# Altium schematic sheet Battery_Management_Section.SchDoc
size A4; DocumentNumber: 4; SheetNumber: 4
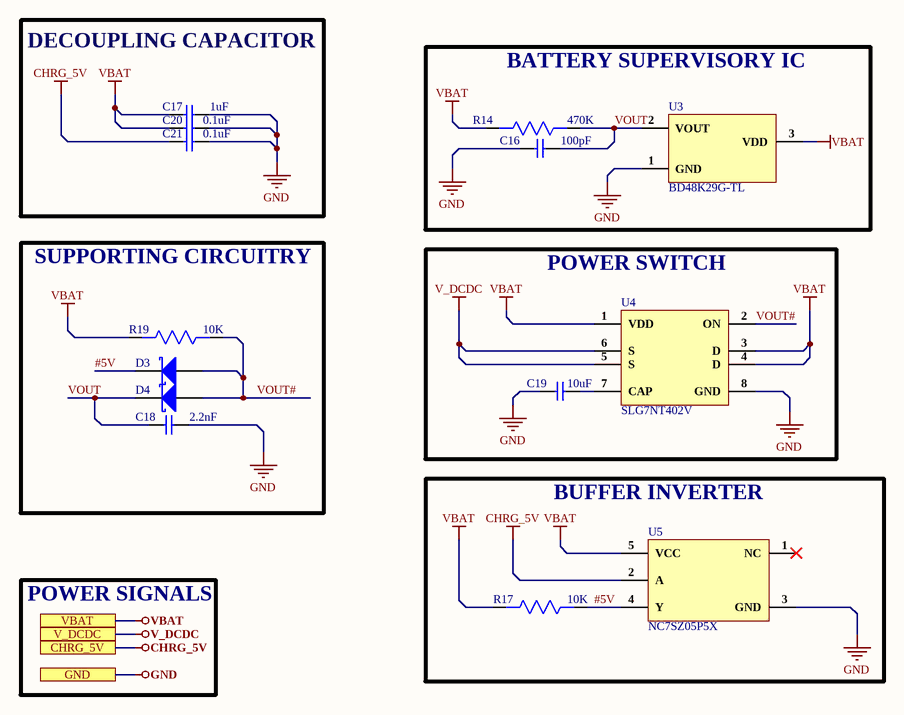
[diagram p0: Battery_Management_Section.SchDoc]

## Parts
C16  100pF  [Cap0603]
C17  1uF  [Cap0603]
C18  2.2nF  [Cap 0402]
C19  10uF  [Cap0603]
C20  0.1uF  [Cap0603]
C21  0.1uF  [Cap0603]
D3  SDM2U20SD3-7  [SDM2U20SD3-7]  (value not drawn)
D4  SDM2U20SD3-7  [SDM2U20SD3-7]  (value not drawn)
R14  470K  [Res0603]
R17  10K  [Res0603]
R19  10K  [Res0603]
U3  BD48K29G-TL  [3-SSOP]
U4  SLG7NT402V  [SLG7NT402V]
U5  NC7SZ05P5X  [NC7SZ05P5X]

## Blocks framed on the sheet
DECOUPLING CAPACITOR: C17 C20 C21
BATTERY SUPERVISORY IC: C16 R14 U3
SUPPORTING CIRCUITRY: C18 D3 D4 R19
POWER SWITCH: C19 U4
BUFFER INVERTER: R17 U5

## Ports
CHRG_5V, GND, V_DCDC, VBAT

## Nets
CHRG_5V: C21.1 U5.2(A) ; port CHRG_5V
GND: C16.2 C17.1 C18.2 C19.1 C20.2 C21.2 U3.1(GND) U4.8(GND) U5.3(GND) ; port GND
V_DCDC: U4.5(S) U4.6(S) ; port V_DCDC
VBAT: C17.2 C20.1 R14.1 R17.2 R19.2 U3.3(VDD) U4.1(VDD) U4.3(D) U4.4(D) U5.5(VCC) ; port VBAT
#5V: D3.2(K) R17.1 U5.4(Y)
VOUT: C16.1 C18.1 D4.2(K) R14.2 U3.2(VOUT)
VOUT#: D3.1(A) D4.1(A) R19.1 U4.2(ON)
NetC19_2: C19.2 U4.7(CAP)

Not connected (* = marked no-connect by the designer): U5 1(NC)*

## Notes on the sheet
- POWER SIGNALS

## Library data of the parts
C16 = CC0603JRNPO8BN101: CAP CER 100PF 25V C0G/NPO 0603; Manufacturer: Yageo; Tolerance: 5%; Dielectric: C0G; ComponentLink1URL: http://www.yageo.com/documents/recent/UPY-GPHC_Y5V_6.3V-to-50V_8.pdf?src-supplier=Digi-Key; ComponentLink1Description: http://www.yageo.com/documents/recent/UPY-GPHC_Y5V_6.3V-to-50V_8.pdf?src-supplier=Digi-Key; ComponentLink2URL: http://www.yageo.com/documents/recent/UPY-GPHC_Y5V_6.3V-to-50V_5.pdf?src-supplier=Avnet+Europe; ComponentLink2Description: http://www.yageo.com/documents/recent/UPY-GPHC_Y5V_6.3V-to-50V_5.pdf?src-supplier=Avnet+Europe; ComponentLink3URL: https://www.verical.com/server-webapp/html/getDatasheet?partID=403611&src-supplier=Verical; ComponentLink3Description: https://www.verical.com/server-webapp/html/getDatasheet?partID=403611&src-supplier=Verical; ComponentLink4URL: http://www.mouser.com/ds/2/447/Yageo_UPY-GP_NP0_16V-to-50V_9-358835.pdf?src-supplier=Mouser; ComponentLink4Description: http://www.mouser.com/ds/2/447/Yageo_UPY-GP_NP0_16V-to-50V_9-358835.pdf?src-supplier=Mouser; ComponentLink5URL: http://www.farnell.com/datasheets/1132289.pdf?src-supplier=Element14; ComponentLink5Description: http://www.farnell.com/datasheets/1132289.pdf?src-supplier=Element14; Supplier 1: Digi-Key; Manufacturer Part Number: CC0603JRNPO8BN101; Stock 1: 19776; Pricing 1: 1=0.1, 10=0.058, 50=0.0318, 100=0.026, 500=0.0186, 1000=0.0146 (USD); Mount: Surface Mount; Case/Package: 0603; Min Operating Temperature: -55°C; Max Operating Temperature: 125°C; Capacitance: 100pF; Voltage Rating (DC): 25V; Packaging: Tape and Reel; Voltage Rating: 25V; Resistor Type: Ceramic; Series: CC; Construction: Flat; Length: 0.063inch; Width: 0.031inch; Height: 0.8mm; Thickness: 0.035inch; Depth: 0.8mm; Radiation Hardening: No; RoHS Compliant: Yes; ComponentLink6URL: http://www.yageo.com/documents/recent/UPY-GP_NP0_16V-to-50V_8.pdf?src-supplier=Avnet; ComponentLink6Description: http://www.yageo.com/documents/recent/UPY-GP_NP0_16V-to-50V_8.pdf?src-supplier=Avnet; ComponentLink7URL: http://www.yageo.com/documents/recent/UPY-GP_NP0_16V-to-50V_8.pdf?src-supplier=Avnet+Europe; ComponentLink7Description: http://www.yageo.com/documents/recent/UPY-GP_NP0_16V-to-50V_8.pdf?src-supplier=Avnet+Europe; Supplier Part Number 1: 311-3949-1-ND
C17 = CC0603ZRY5V8BB105: CAP CER 1UF 25V Y5V 0603; Manufacturer: Yageo; Tolerance: 80%; ComponentLink1URL: http://www.yageo.com/documents/recent/UPY-GPHC_Y5V_6.3V-to-50V_8.pdf?src-supplier=Digi-Key; ComponentLink1Description: http://www.yageo.com/documents/recent/UPY-GPHC_Y5V_6.3V-to-50V_8.pdf?src-supplier=Digi-Key; ComponentLink2URL: http://www.yageo.com/documents/recent/UPY-GPHC_Y5V_6.3V-to-50V_5.pdf?src-supplier=Avnet+Europe; ComponentLink2Description: http://www.yageo.com/documents/recent/UPY-GPHC_Y5V_6.3V-to-50V_5.pdf?src-supplier=Avnet+Europe; ComponentLink3URL: https://www.verical.com/server-webapp/html/getDatasheet?partID=403611&src-supplier=Verical; ComponentLink3Description: https://www.verical.com/server-webapp/html/getDatasheet?partID=403611&src-supplier=Verical; ComponentLink4URL: http://www.mouser.com/ds/2/447/Yageo_UPY-GP_NP0_16V-to-50V_9-358835.pdf?src-supplier=Mouser; ComponentLink4Description: http://www.mouser.com/ds/2/447/Yageo_UPY-GP_NP0_16V-to-50V_9-358835.pdf?src-supplier=Mouser; ComponentLink5URL: http://www.farnell.com/datasheets/1132289.pdf?src-supplier=Element14; ComponentLink5Description: http://www.farnell.com/datasheets/1132289.pdf?src-supplier=Element14; Supplier 1: Digi-Key; Manufacturer Part Number: CC0603ZRY5V8BB105; Stock 1: 82432; Pricing 1: 1=0.13, 10=0.096, 50=0.0544, 100=0.045, 500=0.0316, 1000=0.0261 (USD); Mount: Surface Mount; Case/Package: 0603; Case Code (Imperial): 0603; Case Code (Metric): 1608; Min Operating Temperature: -30°C; Max Operating Temperature: 85°C; Voltage Rating (DC): 25V; Packaging: Tape and Reel; Capacitance: 1uF; Voltage Rating: 25V; Dielectric: Y5V; Termination: SMD/SMT; Resistor Type: Ceramic; Series: CC; Length: 0.063inch; Width: 0.031inch; Height: 0.8mm; Thickness: 0.035inch; Lead Free: Lead Free; Halogen Free: Halogen Free; RoHS Compliant: Yes; Supplier Part Number 1: 311-1829-1-ND
C18 = C0402C222J3GEC7867: CAP CER 0402 2.2NF 25V C0G 5%; Manufacturer: KEMET; ComponentLink1URL: http://www.yageo.com/documents/recent/UPY-GPHC_Y5V_6.3V-to-50V_8.pdf?src-supplier=Digi-Key; ComponentLink1Description: http://www.yageo.com/documents/recent/UPY-GPHC_Y5V_6.3V-to-50V_8.pdf?src-supplier=Digi-Key; ComponentLink2URL: http://www.yageo.com/documents/recent/UPY-GPHC_Y5V_6.3V-to-50V_5.pdf?src-supplier=Avnet+Europe; ComponentLink2Description: http://www.yageo.com/documents/recent/UPY-GPHC_Y5V_6.3V-to-50V_5.pdf?src-supplier=Avnet+Europe; ComponentLink3URL: https://www.verical.com/server-webapp/html/getDatasheet?partID=403611&src-supplier=Verical; ComponentLink3Description: https://www.verical.com/server-webapp/html/getDatasheet?partID=403611&src-supplier=Verical; ComponentLink4URL: http://www.mouser.com/ds/2/447/Yageo_UPY-GP_NP0_16V-to-50V_9-358835.pdf?src-supplier=Mouser; ComponentLink4Description: http://www.mouser.com/ds/2/447/Yageo_UPY-GP_NP0_16V-to-50V_9-358835.pdf?src-supplier=Mouser; ComponentLink5URL: http://www.farnell.com/datasheets/1132289.pdf?src-supplier=Element14; ComponentLink5Description: http://www.farnell.com/datasheets/1132289.pdf?src-supplier=Element14; ComponentLink6URL: http://www.yageo.com/documents/recent/UPY-GP_NP0_16V-to-50V_8.pdf?src-supplier=Avnet; ComponentLink6Description: http://www.yageo.com/documents/recent/UPY-GP_NP0_16V-to-50V_8.pdf?src-supplier=Avnet; ComponentLink7URL: http://www.yageo.com/documents/recent/UPY-GP_NP0_16V-to-50V_8.pdf?src-supplier=Avnet+Europe; ComponentLink7Description: http://www.yageo.com/documents/recent/UPY-GP_NP0_16V-to-50V_8.pdf?src-supplier=Avnet+Europe; Supplier 1: Digi-Key; Manufacturer Part Number: C0402C222J3GEC7867; Stock 1: 5024; Pricing 1: 1=0.17, 10=0.123, 50=0.07, 100=0.058, 500=0.0407, 1000=0.0337, 2500=0.0314, 5000=0.0287 (USD); ComponentLink8URL: https://api.kemet.com/component-edge/download/datasheet/C0402C222J3GEC7867.pdf?src-supplier=Digi-Key; ComponentLink8Description: https://api.kemet.com/component-edge/download/datasheet/C0402C222J3GEC7867.pdf?src-supplier=Digi-Key; Supplier Part Number 1: 399-C0402C222J3GEC7867CT-ND
C19 = CC0603MRX5R8BB106: CAP CER 10UF 25V X5R 0603; Manufacturer: Yageo; Tolerance: 20%; ComponentLink1URL: http://www.yageo.com/documents/recent/UPY-GPHC_Y5V_6.3V-to-50V_8.pdf?src-supplier=Digi-Key; ComponentLink1Description: http://www.yageo.com/documents/recent/UPY-GPHC_Y5V_6.3V-to-50V_8.pdf?src-supplier=Digi-Key; ComponentLink2URL: http://www.yageo.com/documents/recent/UPY-GPHC_Y5V_6.3V-to-50V_5.pdf?src-supplier=Avnet+Europe; ComponentLink2Description: http://www.yageo.com/documents/recent/UPY-GPHC_Y5V_6.3V-to-50V_5.pdf?src-supplier=Avnet+Europe; ComponentLink3URL: https://www.verical.com/server-webapp/html/getDatasheet?partID=403611&src-supplier=Verical; ComponentLink3Description: https://www.verical.com/server-webapp/html/getDatasheet?partID=403611&src-supplier=Verical; ComponentLink4URL: http://www.mouser.com/ds/2/447/Yageo_UPY-GP_NP0_16V-to-50V_9-358835.pdf?src-supplier=Mouser; ComponentLink4Description: http://www.mouser.com/ds/2/447/Yageo_UPY-GP_NP0_16V-to-50V_9-358835.pdf?src-supplier=Mouser; ComponentLink5URL: http://www.farnell.com/datasheets/1132289.pdf?src-supplier=Element14; ComponentLink5Description: http://www.farnell.com/datasheets/1132289.pdf?src-supplier=Element14; Supplier 1: Digi-Key; Manufacturer Part Number: CC0603MRX5R8BB106; Stock 1: 0; Pricing 1: 1=0.77, 10=0.568, 50=0.4542, 100=0.3893, 500=0.3082, 1000=0.2595 (USD); Mount: Surface Mount; Case/Package: 0603; Case Code (Imperial): 0603; Case Code (Metric): 1608; Min Operating Temperature: -55°C; Max Operating Temperature: 85°C; Packaging: Cut Tape; Capacitance: 10uF; Voltage Rating: 25V; RoHS Compliant: Yes; ComponentLink6URL: https://www.yageo.com/upload/media/product/productsearch/datasheet/mlcc/UPY-GPHC_X5R_4V-to-50V_26.pdf?src-supplier=Digi-Key; ComponentLink6Description: https://www.yageo.com/upload/media/product/productsearch/datasheet/mlcc/UPY-GPHC_X5R_4V-to-50V_26.pdf?src-supplier=Digi-Key; Supplier Part Number 1: 311-3494-6-ND
C20 C21 = CC0603ZRY5V9BB104: CAP CER 0.1UF 50V Y5V 0603; Manufacturer: Yageo; Capacitance: 100nF; Tolerance: 80%; Supplier 1: Digi-Key; Manufacturer Part Number: CC0603ZRY5V9BB104; Stock 1: 15000880; Pricing 1: 1=0.1, 10=0.075, 100=0.0334, 500=0.02386, 1000=0.01874 (USD); Mount: Surface Mount; Case/Package: 0603; Number of Pins: 2; Case Code (Metric): 1608; Case Code (Imperial): 0603; Min Operating Temperature: -30°C; Max Operating Temperature: 85°C; Dielectric: Y5V; Voltage Rating: 50V; Package Quantity: 1; Packaging: Tape and Reel; Voltage Rating (DC): 50V; Termination: SMD/SMT; Composition: Ceramic; Voltage: 50V; Length: 1.6mm; Height: 0.8mm; Width: 0.031inch; Thickness: 0.035inch; Depth: 0.8mm; Radiation Hardening: No; REACH SVHC: No SVHC; Lead Free: Lead Free; Halogen Free: Halogen Free; ComponentLink1URL: http://www.yageo.com/documents/recent/UPY-GPHC_Y5V_6.3V-to-50V_8.pdf?src-supplier=Digi-Key; ComponentLink1Description: http://www.yageo.com/documents/recent/UPY-GPHC_Y5V_6.3V-to-50V_8.pdf?src-supplier=Digi-Key; ComponentLink2URL: http://www.yageo.com/documents/recent/UPY-GPHC_Y5V_6.3V-to-50V_5.pdf?src-supplier=Avnet+Europe; ComponentLink2Description: http://www.yageo.com/documents/recent/UPY-GPHC_Y5V_6.3V-to-50V_5.pdf?src-supplier=Avnet+Europe; ComponentLink3URL: https://www.verical.com/server-webapp/html/getDatasheet?partID=403611&src-supplier=Verical; ComponentLink3Description: https://www.verical.com/server-webapp/html/getDatasheet?partID=403611&src-supplier=Verical; ComponentLink4URL: http://www.mouser.com/ds/2/447/Yageo_UPY-GP_NP0_16V-to-50V_9-358835.pdf?src-supplier=Mouser; ComponentLink4Description: http://www.mouser.com/ds/2/447/Yageo_UPY-GP_NP0_16V-to-50V_9-358835.pdf?src-supplier=Mouser; ComponentLink5URL: http://www.farnell.com/datasheets/1132289.pdf?src-supplier=Element14; ComponentLink5Description: http://www.farnell.com/datasheets/1132289.pdf?src-supplier=Element14; Supplier Part Number 1: 311-1343-1-ND
D3 D4 = SDM2U20SD3-7: DIODE SCHOTTKY 20V 2A SOD323; Manufacturer: Diodes; Supplier 1: Digi-Key; Manufacturer Part Number: SDM2U20SD3-7; RoHS: Yes; Category: Rectifier Diodes; Stock 1: 6; Pricing 1: 1=0.47000, 10=0.35200, 100=0.19930, 500=0.13200, 1000=0.10120 (USD); Mount: Surface Mount; Packaging: Cut Tape; Average Rectified Current: 2A; Max Reverse Voltage (DC): 20V; RoHS Compliant: Yes; ComponentLink1URL: http://www.mouser.com/ds/2/115/SDM2U20SD3-537776.pdf?src-supplier=Mouser; ComponentLink1Description: http://www.mouser.com/ds/2/115/SDM2U20SD3-537776.pdf?src-supplier=Mouser; ComponentLink2URL: https://www.diodes.com/assets/Datasheets/SDM2U20SD3.pdf?src-supplier=Digi-Key; ComponentLink2Description: https://www.diodes.com/assets/Datasheets/SDM2U20SD3.pdf?src-supplier=Digi-Key; ComponentLink3URL: http://diodes.com/datasheets/SDM2U20SD3.pdf?src-supplier=Avnet; ComponentLink3Description: http://diodes.com/datasheets/SDM2U20SD3.pdf?src-supplier=Avnet; Supplier Part Number 1: SDM2U20SD3-7DICT-ND
R14 = RC0603JR-07470KL: RES 470K OHM 5% 1/10W 0603; Manufacturer: Yageo; Resistance: 470kR; Temperature Coefficient: 100ppm/°C; Voltage Rating (DC): 50V; Power Rating: 100mW; Voltage Rating: 75V; ComponentLink1URL: https://datasheet.ciiva.com/2452/pyu-r-int-thick-7-2452918.pdf?src-supplier=Digi-Key; ComponentLink1Description: https://datasheet.ciiva.com/2452/pyu-r-int-thick-7-2452918.pdf?src-supplier=Digi-Key; ComponentLink2URL: https://datasheet.ciiva.com/2452/pyu-r-int-thick-7-2452919.pdf?src-supplier=Digi-Key; ComponentLink2Description: https://datasheet.ciiva.com/2452/pyu-r-int-thick-7-2452919.pdf?src-supplier=Digi-Key; ComponentLink3URL: https://datasheet.ciiva.com/7746/443971-7746489.pdf?src-supplier=Element14; ComponentLink3Description: https://datasheet.ciiva.com/7746/443971-7746489.pdf?src-supplier=Element14; ComponentLink4URL: https://datasheet.ciiva.com/7746/443971-7746490.pdf?src-supplier=Element14; ComponentLink4Description: https://datasheet.ciiva.com/7746/443971-7746490.pdf?src-supplier=Element14; ComponentLink5URL: https://datasheet.ciiva.com/46395/443971-46395146.pdf?src-supplier=Element14; ComponentLink5Description: https://datasheet.ciiva.com/46395/443971-46395146.pdf?src-supplier=Element14; ComponentLink6URL: https://datasheet.ciiva.com/15189/getdatasheetpartid-343810-15189869.pdf?src-supplier=Verical; ComponentLink6Description: https://datasheet.ciiva.com/15189/getdatasheetpartid-343810-15189869.pdf?src-supplier=Verical; Supplier 1: Digi-Key; Manufacturer Part Number: RC0603JR-07470KL; Stock 1: 1213798; Pricing 1: 1=0.1, 10=0.02, 100=0.008, 1000=0.0036, 2500=0.0031 (USD); Case/Package: 0603; Number of Pins: 2; Case Code (Metric): 1608; Case Code (Imperial): 0603; Weight: 7.1E-05oz; Size Code: 0603; Min Operating Temperature: -55°C; Max Operating Temperature: 155°C; Tolerance: 5%; Resistor Type: Thick Film; Packaging: Tape and Reel; Package Quantity: 1; Number of Terminations: 2; Termination: SMD/SMT; Max Power Dissipation: 100mW; Features: Moisture Resistant; Series: RC; Resistance Tolerance: 5%; Construction: Rectangular; Length: 1.6mm; Width: 0.8mm; Height: 0.022inch; Depth: 0.8mm; REACH SVHC: No SVHC; Lead Free: Lead Free; Military Standard: Not; RoHS Compliant: Yes; ComponentLink7URL: http://www.yageo.com/documents/recent/PYu-RC_Group_51_RoHS_L_10.pdf?src-supplier=Digi-Key; ComponentLink7Description: http://www.yageo.com/documents/recent/PYu-RC_Group_51_RoHS_L_10.pdf?src-supplier=Digi-Key; ComponentLink8URL: http://www.yageo.com/documents/recent/PYu-RC_Group_51_RoHS_L_9.pdf?src-supplier=Digi-Key; ComponentLink8Description: http://www.yageo.com/documents/recent/PYu-RC_Group_51_RoHS_L_9.pdf?src-supplier=Digi-Key; ComponentLink9URL: http://www.farnell.com/datasheets/1868787.pdf?src-supplier=Element14; ComponentLink9Description: http://www.farnell.com/datasheets/1868787.pdf?src-supplier=Element14; Supplier Part Number 1: 311-470KGRCT-ND
R17 R19 = AC0603JR-0710KL: RES SMD 10K OHM 5% 1/10W 0603; Manufacturer: Yageo; Voltage Rating: 50V; Resistance: 10kR; Power Rating: 100mW; Temperature Coefficient: 100ppm/°C; Supplier 1: Future Electronics; Manufacturer Part Number: AC0603JR-0710KL; RoHS: Yes; Category: Chip SMD Resistors; Stock 1: 1533000; Pricing 1: 5000=0.00540 (USD); Case/Package: 0603; Case Code (Imperial): 0603; Case Code (Metric): 1608; Size Code: 0603; Min Operating Temperature: -55°C; Max Operating Temperature: 155°C; Packaging: Tape and Reel; Tolerance: 5%; Package Quantity: 1; Resistor Type: Thick Film; Termination: SMD/SMT; Number of Terminations: 2; Max Power Dissipation: 100mW; Features: Moisture Resistant,Automotive AEC-Q200,Anti-Sulfur; Series: AC; Construction: Rectangular; Length: 0.063inch; Width: 0.031inch; Height: 0.022inch; Depth: 0.8mm; Military Standard: Not; Lead Free: Lead Free; RoHS Compliant: Yes; ComponentLink1URL: https://datasheet.ciiva.com/5562/pyu-ac-51-rohs-l-2-5562553.pdf?src-supplier=Mouser; ComponentLink1Description: https://datasheet.ciiva.com/5562/pyu-ac-51-rohs-l-2-5562553.pdf?src-supplier=Mouser; Supplier Part Number 1: 1029044
U3 = BD48K29G-TL: IC DETECTOR VOLT 2.9V OD SSOP3; Manufacturer: Rohm; Max Supply Voltage: 6V; Min Supply Voltage: 2.3V; Number of Voltages Monitored: 1; Reset: Active Low; Accuracy: 1%; Operating Supply Current: 900nA; Max Reset Threshold Voltage: 2.929V; Min Reset Threshold Voltage: 2.871V; Supplier 1: Mouser; Manufacturer Part Number: BD48K29G-TL; RoHS: Yes; Category: Voltage Supervisors; Stock 1: 2854; Pricing 1: 1=0.48000, 10=0.39100, 50=0.39100, 100=0.24100, 500=0.20000, 1000=0.15000, 3000=0.13600, 10000=0.13600 (USD); Mount: Surface Mount; Case/Package: SSOP; Number of Pins: 3; Min Operating Temperature: -40°C; Max Operating Temperature: 105°C; Packaging: Tape and Reel; Package Quantity: 1; Threshold Voltage: 2.9V; Number of Monitored Inputs: 1; Type: Simple Reset/Power-On Reset,Voltage Detector; Series: BD48xxx; Radiation Hardening: No; Lead Free: Lead Free; RoHS Compliant: Yes; ComponentLink1URL: https://datasheet.ciiva.com/15105/getdatasheetpartid-705726-15105774.pdf?src-supplier=Verical; ComponentLink1Description: https://datasheet.ciiva.com/15105/getdatasheetpartid-705726-15105774.pdf?src-supplier=Verical; ComponentLink2URL: https://datasheet.ciiva.com/6598/bd48xxg-e-6598662.pdf?src-supplier=Digi-Key; ComponentLink2Description: https://datasheet.ciiva.com/6598/bd48xxg-e-6598662.pdf?src-supplier=Digi-Key; Supplier Part Number 1: 755-BD48K29G-TL
U4 = SLG7NT402V: IC PWR SWITCH N-CHAN 1:1 8TDFN; Manufacturer: Dialog Semiconductor; Number of Outputs: 1; Output Configuration: High Side; Max Output Current: 4A; ComponentLink1URL: https://datasheet.ciiva.com/3231/lmr62014-3231410.pdf?src-supplier=Avnet; ComponentLink1Description: https://datasheet.ciiva.com/3231/lmr62014-3231410.pdf?src-supplier=Avnet; ComponentLink2URL: https://datasheet.ciiva.com/23854/1777788-23854326.pdf?src-supplier=Newark; ComponentLink2Description: https://datasheet.ciiva.com/23854/1777788-23854326.pdf?src-supplier=Newark; ComponentLink3URL: https://datasheet.ciiva.com/4879/snvs735a-74121-4879731.pdf?src-supplier=Mouser; ComponentLink3Description: https://datasheet.ciiva.com/4879/snvs735a-74121-4879731.pdf?src-supplier=Mouser; ComponentLink4URL: https://datasheet.ciiva.com/22669/1716576-22669414.pdf?src-supplier=Element14; ComponentLink4Description: https://datasheet.ciiva.com/22669/1716576-22669414.pdf?src-supplier=Element14; ComponentLink5URL: https://datasheet.ciiva.com/6603/lmr62014-6603804.pdf?src-supplier=Digi-Key; ComponentLink5Description: https://datasheet.ciiva.com/6603/lmr62014-6603804.pdf?src-supplier=Digi-Key; ComponentLink6URL: https://datasheet.ciiva.com/6603/lmr62014-6603807.pdf?src-supplier=Digi-Key; ComponentLink6Description: https://datasheet.ciiva.com/6603/lmr62014-6603807.pdf?src-supplier=Digi-Key; ComponentLink7URL: https://www.verical.com/server-webapp/html/getDatasheet?partID=705722&src-supplier=Verical; ComponentLink7Description: https://www.verical.com/server-webapp/html/getDatasheet?partID=705722&src-supplier=Verical; ComponentLink8URL: http://rohmfs.rohm.com/en/techdata_basic/ic/package/ssop3_1-e.pdf?src-supplier=Digi-Key; ComponentLink8Description: http://rohmfs.rohm.com/en/techdata_basic/ic/package/ssop3_1-e.pdf?src-supplier=Digi-Key; ComponentLink9URL: http://rohmfs.rohm.com/en/products/databook/datasheet/ic/power/voltage_detector/bd48xxg-e.pdf?src-supplier=Digi-Key; ComponentLink9Description: http://rohmfs.rohm.com/en/products/databook/datasheet/ic/power/voltage_detector/bd48xxg-e.pdf?src-supplier=Digi-Key; Supplier 1: Digi-Key; Manufacturer Part Number: SLG7NT402V; Stock 1: 74575; Pricing 1: 1=0.67, 10=0.591, 25=0.5548, 100=0.4529, 250=0.4206, 500=0.358, 1000=0.2864 (USD); Number of Pins: 8; Min Operating Temperature: -20°C; Max Operating Temperature: 70°C; Packaging: Cut Tape; Supplier Part Number 1: 1827-1124-1-ND
U5 = NC7SZ05P5X: IC INVERTER OD 1CH 1-INP SC70-5; Manufacturer: ON Semiconductor / Fairchild; Number of Terminals/Pins: 5; Number of Circuits: 1; Max Supply Voltage: 5.5V; Min Supply Voltage: 1.65V; Propagation Delay: 13.4ns; Logic Function: Buffer,Inverter; Output Current: 32mA; Quiescent Current: 2uA; Turn-On Delay Time: 4.3ns; Polarity: Inverting; Schmitt Trigger Input: No; Input Type: SINGLE-ENDED; ComponentLink1URL: https://datasheet.ciiva.com/3231/lmr62014-3231410.pdf?src-supplier=Avnet; ComponentLink1Description: https://datasheet.ciiva.com/3231/lmr62014-3231410.pdf?src-supplier=Avnet; ComponentLink2URL: https://datasheet.ciiva.com/23854/1777788-23854326.pdf?src-supplier=Newark; ComponentLink2Description: https://datasheet.ciiva.com/23854/1777788-23854326.pdf?src-supplier=Newark; ComponentLink3URL: https://datasheet.ciiva.com/4879/snvs735a-74121-4879731.pdf?src-supplier=Mouser; ComponentLink3Description: https://datasheet.ciiva.com/4879/snvs735a-74121-4879731.pdf?src-supplier=Mouser; ComponentLink4URL: https://datasheet.ciiva.com/22669/1716576-22669414.pdf?src-supplier=Element14; ComponentLink4Description: https://datasheet.ciiva.com/22669/1716576-22669414.pdf?src-supplier=Element14; ComponentLink5URL: https://datasheet.ciiva.com/6603/lmr62014-6603804.pdf?src-supplier=Digi-Key; ComponentLink5Description: https://datasheet.ciiva.com/6603/lmr62014-6603804.pdf?src-supplier=Digi-Key; ComponentLink6URL: https://datasheet.ciiva.com/6603/lmr62014-6603807.pdf?src-supplier=Digi-Key; ComponentLink6Description: https://datasheet.ciiva.com/6603/lmr62014-6603807.pdf?src-supplier=Digi-Key; Supplier 1: Digi-Key; Manufacturer Part Number: NC7SZ05P5X; RoHS: Yes; Category: Amplifiers - Op Amps, Buffer, Instrumentation; Stock 1: 165573; Pricing 1: 1=0.41000, 10=0.30800, 25=0.26920, 100=0.17430, 250=0.14428, 500=0.11544, 1000=0.08850 (USD); Mount: Surface Mount; Case/Package: SC; Number of Pins: 5; Weight: 23g; Min Operating Temperature: -40°C; Max Operating Temperature: 85°C; Packaging: Tape and Reel; Package Quantity: 1; Low Level Output Current: 32mA; Number of Gates: 1; Number of Channels: 1; Number of Inputs: 1; Number of Outputs: 1; Max Output Current: 32mA; Number of Elements: 1; Termination: SMD/SMT; Series: 7SZ; Technology: CMOS; Number of Functions: 1; Supply Voltage-Nom: 5.5V; Length: 2mm; Width: 1.25mm; Height: 1mm; Radiation Hardening: No; REACH SVHC: No SVHC; Lead Free: Lead Free; RoHS Compliant: Yes; ComponentLink7URL: https://datasheet.ciiva.com/5701/678459-5701517.pdf?src-supplier=Farnell; ComponentLink7Description: https://datasheet.ciiva.com/5701/678459-5701517.pdf?src-supplier=Farnell; ComponentLink8URL: https://datasheet.ciiva.com/26097/nc7sz05-26097353.pdf?src-supplier=Avnet+Europe; ComponentLink8Description: https://datasheet.ciiva.com/26097/nc7sz05-26097353.pdf?src-supplier=Avnet+Europe; ComponentLink9URL: https://datasheet.ciiva.com/46415/678459-46415099.pdf?src-supplier=Element14; ComponentLink9Description: https://datasheet.ciiva.com/46415/678459-46415099.pdf?src-supplier=Element14; ComponentLink10URL: https://datasheet.ciiva.com/16783/nc7sz05-16783085.pdf?src-supplier=Future+Electronics; ComponentLink10Description: https://datasheet.ciiva.com/16783/nc7sz05-16783085.pdf?src-supplier=Future+Electronics; ComponentLink11URL: https://datasheet.ciiva.com/1861/nc7sz05-1861934.pdf?src-supplier=Digi-Key; ComponentLink11Description: https://datasheet.ciiva.com/1861/nc7sz05-1861934.pdf?src-supplier=Digi-Key; ComponentLink12URL: https://datasheet.ciiva.com/7970/678459-7970639.pdf?src-supplier=Element14; ComponentLink12Description: https://datasheet.ciiva.com/7970/678459-7970639.pdf?src-supplier=Element14; ComponentLink13URL: https://datasheet.ciiva.com/1861/nc7sz05-1861932.pdf?src-supplier=Digi-Key; ComponentLink13Description: https://datasheet.ciiva.com/1861/nc7sz05-1861932.pdf?src-supplier=Digi-Key; ComponentLink14URL: https://datasheet.ciiva.com/5701/nc7sz05-5701516.pdf?src-supplier=Farnell; ComponentLink14Description: https://datasheet.ciiva.com/5701/nc7sz05-5701516.pdf?src-supplier=Farnell; ComponentLink15URL: https://datasheet.ciiva.com/1861/nc7sz05-1861933.pdf?src-supplier=Digi-Key; ComponentLink15Description: https://datasheet.ciiva.com/1861/nc7sz05-1861933.pdf?src-supplier=Digi-Key; Supplier Part Number 1: NC7SZ05P5XCT-ND